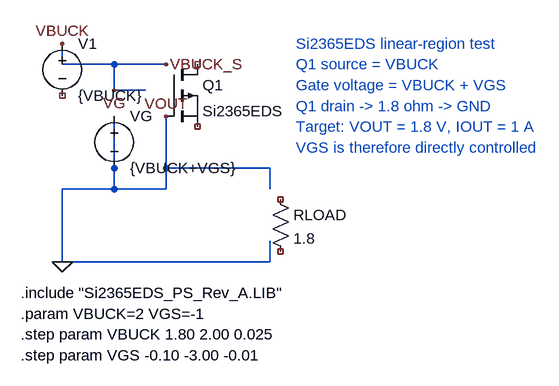
[diagram p0: schematic Si2365EDS_linear_test.asc]
Si2365EDS_linear_test.asc, the LTspice schematic file:
Version 4
SHEET 1 880 680
WIRE 320 160 160 160
WIRE 160 160 160 128
WIRE 320 240 320 320
WIRE 320 320 320 352
WIRE 320 352 160 352
WIRE 160 352 160 384
WIRE 288 200 240 200
WIRE 240 200 240 160
WIRE 240 160 320 160
WIRE 240 240 240 352
WIRE 320 320 480 320
WIRE 480 320 480 352
WIRE 480 432 480 464
WIRE 480 464 160 464
WIRE 160 384 160 464
FLAG 160 128 VBUCK
FLAG 160 464 0
FLAG 320 160 VBUCK_S
FLAG 320 240 VOUT
FLAG 240 200 VG
SYMBOL voltage 160 112 R0
SYMATTR InstName V1
SYMATTR Value {VBUCK}
SYMATTR SpiceLine Rser=0
SYMBOL pmos 320 160 R0
SYMATTR InstName Q1
SYMATTR Value Si2365EDS
SYMATTR Prefix X
SYMATTR SpiceModel Si2365EDS
SYMBOL voltage 240 224 R0
SYMATTR InstName VG
SYMATTR Value {VBUCK+VGS}
SYMATTR SpiceLine Rser=0
SYMBOL res 480 352 R0
SYMATTR InstName RLOAD
SYMATTR Value 1.8
TEXT 96 512 Left 2 !.include "Si2365EDS_PS_Rev_A.LIB"
TEXT 96 544 Left 2 !.param VBUCK=2 VGS=-1
TEXT 96 576 Left 2 !.step param VBUCK 1.80 2.00 0.025
TEXT 96 608 Left 2 !.step param VGS -0.10 -3.00 -0.01
TEXT 520 128 Left 2 ;Si2365EDS linear-region test
TEXT 520 160 Left 2 ;Q1 source = VBUCK
TEXT 520 192 Left 2 ;Gate voltage = VBUCK + VGS
TEXT 520 224 Left 2 ;Q1 drain -> 1.8 ohm -> GND
TEXT 520 256 Left 2 ;Target: VOUT = 1.8 V, IOUT = 1 A
TEXT 520 288 Left 2 ;VGS is therefore directly controlled

The netlist it stands for:
* Si2365EDS_linear_test.asc
V1 VG NC_01 {VBUCK} Rser=0
XQ1 NC_02 0 NC_03 Si2365EDS Si2365EDS  ; pins D G S
VG 0 0 {VBUCK+VGS} Rser=0
RLOAD NC_04 NC_05 1.8
.include "Si2365EDS_PS_Rev_A.LIB"
.param VBUCK=2 VGS=-1
.step param VBUCK 1.80 2.00 0.025
.step param VGS -0.10 -3.00 -0.01
* Si2365EDS linear-region test
* Q1 source = VBUCK
* Gate voltage = VBUCK + VGS
* Q1 drain -> 1.8 ohm -> GND
* Target: VOUT = 1.8 V, IOUT = 1 A
* VGS is therefore directly controlled
.backanno
.end